# Altium schematic sheet adl5960-main.SchDoc: ADL5960 + Sterowanie
size 420 x 297 mm; SheetNumber: 2; SheetTotal: 2; DocumentType: Schemat elektryczny
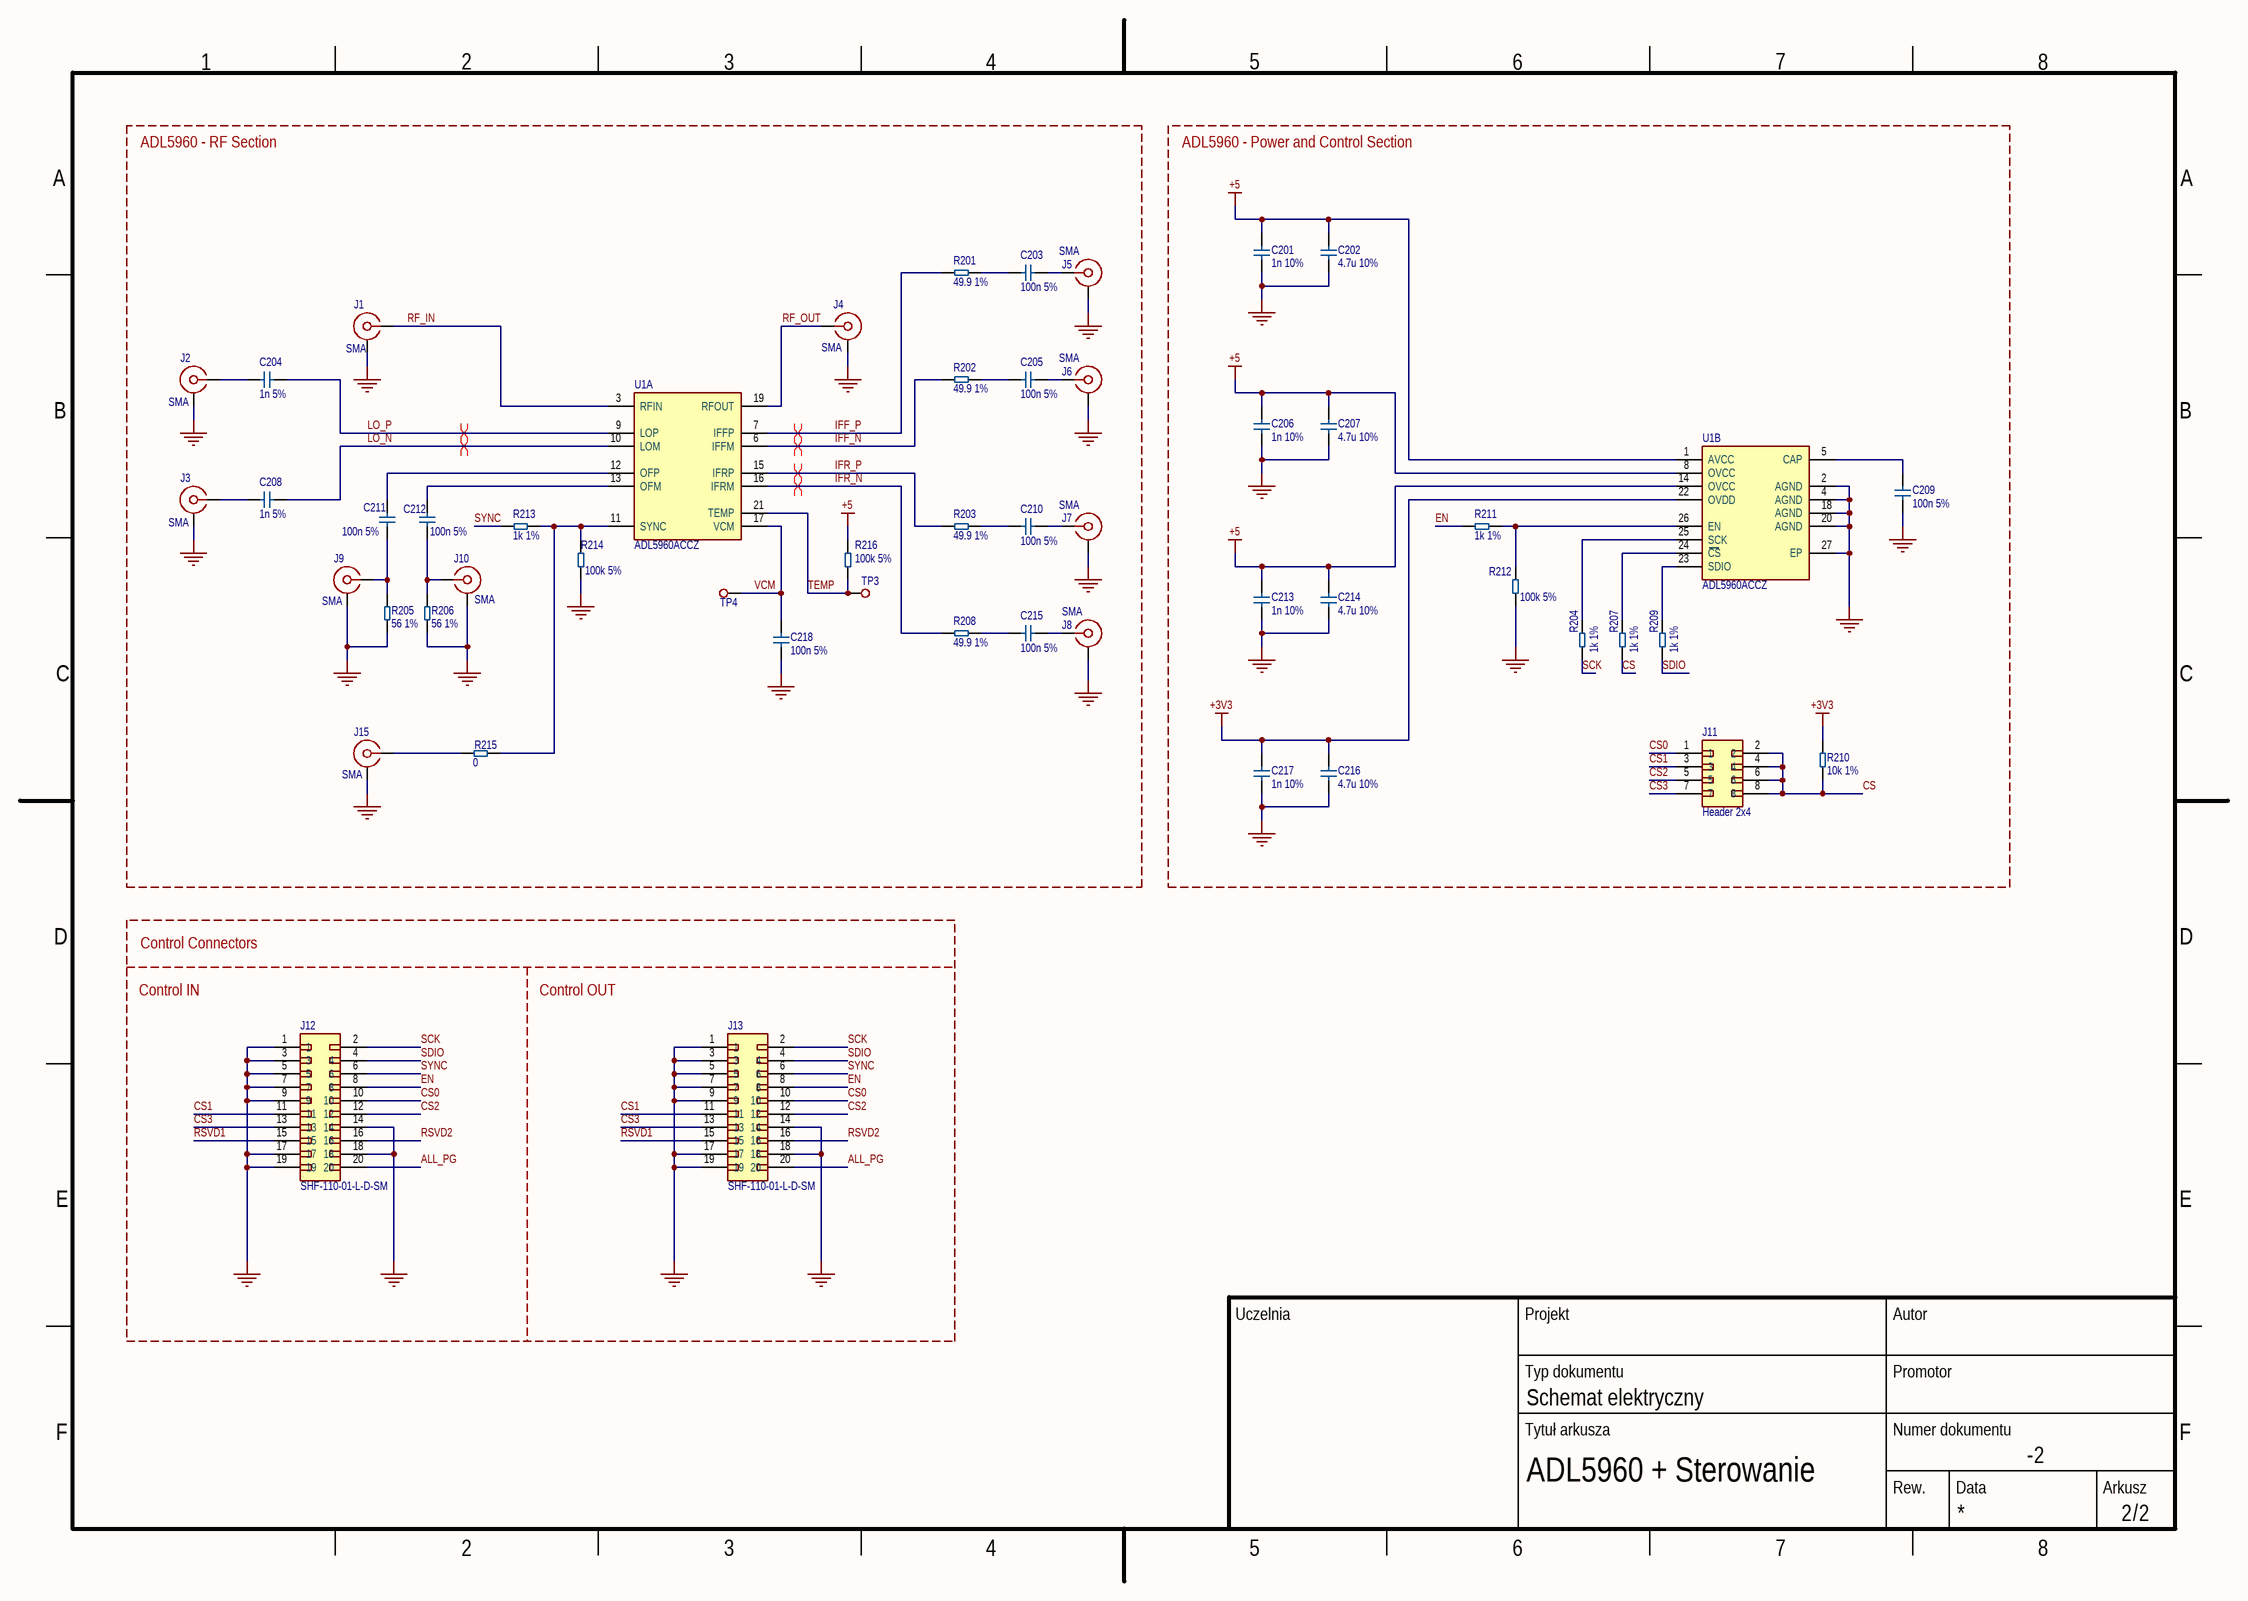
[diagram p0: adl5960-main.SchDoc]

## Parts
C201  1n 10%  [c-0402]
C202  4.7u 10%  [c-0805]
C203  100n 5%  [c-0603]
C204  1n 5%  [c-0402]
C205  100n 5%  [c-0603]
C206  1n 10%  [c-0402]
C207  4.7u 10%  [c-0805]
C208  1n 5%  [c-0402]
C209  100n 5%  [c-0603]
C210  100n 5%  [c-0603]
C211  100n 5%  [c-0603]
C212  100n 5%  [c-0603]
C213  1n 10%  [c-0402]
C214  4.7u 10%  [c-0805]
C215  100n 5%  [c-0603]
C216  4.7u 10%  [c-0805]
C217  1n 10%  [c-0402]
C218  100n 5%  [c-0603]
J1  SMA  [32K243-40ML5]
J2  SMA  [32K243-40ML5]
J3  SMA  [32K243-40ML5]
J4  SMA  [32K243-40ML5]
J5  SMA  [32K243-40ML5]
J6  SMA  [32K243-40ML5]
J7  SMA  [32K243-40ML5]
J8  SMA  [32K243-40ML5]
J9  SMA  [32K243-40ML5]
J10  SMA  [32K243-40ML5]
J11  Header 2x4  [Header-2x4-THT-P2.54]
J12  SHF-110-01-L-D-SM  [SHF-110-01-L-D-SM]
J13  SHF-110-01-L-D-SM  [SHF-110-01-L-D-SM]
J15  SMA  [32K243-40ML5]
R201  49.9 1%  [r-0603]
R202  49.9 1%  [r-0603]
R203  49.9 1%  [r-0603]
R204  1k 1%  [r-0603]
R205  56 1%  [r-0603]
R206  56 1%  [r-0603]
R207  1k 1%  [r-0603]
R208  49.9 1%  [r-0603]
R209  1k 1%  [r-0603]
R210  10k 1%  [r-0603]
R211  1k 1%  [r-0603]
R212  100k 5%  [r-0603]
R213  1k 1%  [r-0603]
R214  100k 5%  [r-0603]
R215  0  [r-0603]
R216  100k 5%  [r-0603]
TP3  Test Point  [tp-keystone-5015]  (value not drawn)
TP4  Test Point  [tp-keystone-5015]  (value not drawn)
U1  ADL5960ACCZ  [ADL5960ACCZ]  (parts A,B of 2)

## Blocks framed on the sheet
ADL5960 - RF Section: C203-C205 C208 C210-C212 C215 C218 J1-J10 J15 R201-R203 R205 R206 R208 R213-R216 TP3 TP4 U1
ADL5960 - Power and Control Section: C201 C202 C206 C207 C209 C213 C214 C216 C217 J11 R204 R207 R209-R212 U1

## Nets
+3V3: C216.2 C217.1 R210.1 U1.22(OVDD)
+5: C201.1 C202.2 C206.1 C207.2 C213.1 C214.2 R216.2 U1.1(AVCC) U1.8(OVCC) U1.14(OVCC)
GND: C201.2 C202.1 C206.2 C207.1 C209.1 C213.2 C214.1 C216.1 C217.2 C218.1 J1.2 J2.2 J3.2 J4.2 J5.2 J6.2 J7.2 J8.2 J9.2 J10.2 J12.1 J12.3 J12.5 J12.7 J12.9 J12.14 J12.17 J12.18 J12.19 J13.1 J13.3 J13.5 J13.7 J13.9 J13.14 J13.17 J13.18 J13.19 J15.2 R205.1 R206.1 R212.1 R214.1 U1.2(AGND) U1.4(AGND) U1.18(AGND) U1.20(AGND) U1.27(EP)
ALL_PG: J12.20 J13.20
CS: J11.2 J11.4 J11.6 J11.8 R207.2 R210.2
CS0: J11.1 J12.10 J13.10
CS1: J11.3 J12.11 J13.11
CS2: J11.5 J12.12 J13.12
CS3: J11.7 J12.13 J13.13
EN: J12.8 J13.8 R211.1
IFF_N: R202.2 U1.6(IFFM)
IFF_P: R201.2 U1.7(IFFP)
IFR_N: R208.2 U1.16(IFRM)
IFR_P: R203.2 U1.15(IFRP)
LO_N: C208.2 U1.10(LOM)
LO_P: C204.2 U1.9(LOP)
RF_IN: J1.1 U1.3(RFIN)
RF_OUT: J4.1 U1.19(RFOUT)
RSVD1: J12.15 J13.15
RSVD2: J12.16 J13.16
SCK: J12.2 J13.2 R204.2
SDIO: J12.4 J13.4 R209.2
SYNC: J12.6 J13.6 R213.1
TEMP: R216.1 TP3.1 U1.21(TEMP)
VCM: C218.2 TP4.1 U1.17(VCM)
NetC203_1: C203.1 R201.1
NetC203_2: C203.2 J5.1
NetC204_1: C204.1 J2.1
NetC205_1: C205.1 R202.1
NetC205_2: C205.2 J6.1
NetC208_1: C208.1 J3.1
NetC209_2: C209.2 U1.5(CAP)
NetC210_1: C210.1 R203.1
NetC210_2: C210.2 J7.1
NetC211_1: C211.1 J9.1 R205.2
NetC211_2: C211.2 U1.12(OFP)
NetC212_1: C212.1 J10.1 R206.2
NetC212_2: C212.2 U1.13(OFM)
NetC215_1: C215.1 R208.1
NetC215_2: C215.2 J8.1
NetJ15_1: J15.1 R215.1
NetR204_1: R204.1 U1.25(SCK)
NetR207_1: R207.1 U1.24(CS)
NetR209_1: R209.1 U1.23(SDIO)
NetR211_2: R211.2 R212.2 U1.26(EN)
NetR213_2: R213.2 R214.2 R215.2 U1.11(SYNC)

## Layout directives
differential pair: IFF_N, IFF_P, IFR_N, IFR_P, LO_N, LO_P

## Notes on the sheet
- 1
- 2
- 3
- 4
- 5
- 6
- 7
- 8
- A
- B
- C
- D
- Control IN
- Control Connectors
- Control OUT
- E
- Uczelnia
- Projekt
- Autor
- Typ dokumentu
- Promotor
- F
- Tytuł arkusza
- Numer dokumentu
- -
- Rew.
- Data
- Arkusz
- /

## Library data of the parts
C201 C206 C213 C217 = capacitor: Generic non-polarized capacitor; Manufacturer: KEMET; Manufacturer Part Number: C0402C102K8GACTU; Voltage Rating: 10V; Dielectric: C0G; Value: 1n; Tolerance: 10%
C202 C207 C214 C216 = Capacitor: Generic non-polarized capacitor; Manufacturer: KEMET; Manufacturer Part Number: C0805C475K4RACTU; Voltage Rating: 16V; Dielectric: X7R; Value: 4.7u; Tolerance: 10%
C203 C205 C209-C212 C215 C218 = Capacitor: Generic non-polarized capacitor; Manufacturer: KEMET; Manufacturer Part Number: C0603C104J4RACTU; Voltage Rating: 16V; Dielectric: X7R; Value: 100n; Tolerance: 5%
C204 C208 = Capacitor: Generic non-polarized capacitor; Manufacturer: KEMET; Manufacturer Part Number: C0402C102J4GACTU; Voltage Rating: 16V; Dielectric: C0G; Value: 1n; Tolerance: 5%
J1-J10 J15 = 32K243-40ML5: Rf Coaxial Connector, 50 Ohm, In-series, Sma Right Angle Jack Pcb, Sma Series; Manufacturer: Rosenberger; Contact Resistance: 3mΩ; Contact Style: Coax; Dielectric Material: PTFE; Frequency: 18GHz; Gender: Female; Impedance: 50Ω; Insertion Loss (dB): 0.17dB; Insulation Resistance: 5GΩ; Number of Contacts: 1; Voltage Rating: 480V; Supplier: Mouser; Supplier Part Number: 476-32K243-40ML5; Manufacturer Part Number: 32K243-40ML5; RoHS: Compliant; Category: RF / Coaxial Connectors; Stock: 5444; Pricing: 1=20.21, 10=17.36, 50=15.71, 100=14.66, 1000=13.36, 10000=13.36 (USD); Ambient Temperature Range High: 165°C; Case/Package: SMA; China RoHS: Non-Compliant; Contact Material: Gold; Contact Plating: Gold; Export Control Classification Number (ECCN) Code: EAR99; Fastening Type: Threaded; Harmonized Tariff Schedule (HTS) Code: 8536.69.40.10; Introduction Date: 2007-04-18; Lifecycle Status: Production; Max Operating Temperature: 165°C; Manufacturer Package Identifier: 32K243-40ML5; Min Operating Temperature: -65°C; Number of Ports: 1; Number of Positions: 1; Orientation: Right Angle; REACH SVHC: Affected; ComponentLink1URL: https://sigma.octopart.com:443/138897775/technical_drawing/Rosenberger-32K243-40ML5.pdf?src-supplier=Upverter; ComponentLink1Description: https://sigma.octopart.com:443/138897775/technical_drawing/Rosenberger-32K243-40ML5.pdf?src-supplier=Upverter; ComponentLink2URL: https://datasheet.octopart.com:443/32K243-40ML5-Rosenberger-datasheet-136490776.pdf?src-supplier=Upverter; ComponentLink2Description: https://datasheet.octopart.com:443/32K243-40ML5-Rosenberger-datasheet-136490776.pdf?src-supplier=Upverter; ComponentLink3URL: https://datasheet.octopart.com:443/32K243-40ML5-Rosenberger-datasheet-181232220.pdf?src-supplier=IHS; ComponentLink3Description: https://datasheet.octopart.com:443/32K243-40ML5-Rosenberger-datasheet-181232220.pdf?src-supplier=IHS; ComponentLink4URL: https://datasheet.octopart.com:443/32K243-40ML5-Rosenberger-datasheet-154574681.pdf?src-supplier=RS+(Formerly+Allied+Electronics); ComponentLink4Description: https://datasheet.octopart.com:443/32K243-40ML5-Rosenberger-datasheet-154574681.pdf?src-supplier=RS+(Formerly+Allied+Electronics); Supplier 1: Mouser; Supplier Part Number 1: 476-32K243-40ML5
J11 = Header-2x4: Dual-row, 8-pin connector; Manufacturer: Samtec; Manufacturer Part Number: TSW-104-07-G-D
J12 J13 = SHF-110-01-L-D-SM: Pin Header, Wire-to-Board, 1.27 mm, 2 Rows, 20 Contacts, Surface Mount, SHF Series; Manufacturer: Samtec; Manufacturer Lifecycle Status: PRODUCTION; Gender: Male; Max Current Rating: 3A; Number of Contacts: 20; Pitch: 1.27mm; Supplier: RS; Supplier Part Number: 9011876; Manufacturer Part Number: SHF-110-01-L-D-SM; RoHS: Compliant; Category: Headers and Wire Housings; Stock: 708; Contact Material: Bronze; Contact Plating: Gold; Depth: 5.59mm; Housing Color: Black; Housing Material: Polymer; Length: 19.05mm; Lifecycle Status: Production; Max Operating Temperature: 125°C; Min Operating Temperature: -55°C; Pins: 20; Number of Rows: 2; Orientation: Straight; Radiation Hardening: No; REACH SVHC: Unaffected; Termination: Solder; ComponentLink1URL: https://sigma.octopart.com:443/97277425/technical_drawing/Samtec-SHF-110-01-L-D-SM.pdf?src-supplier=Samtec; ComponentLink1Description: https://sigma.octopart.com:443/97277425/technical_drawing/Samtec-SHF-110-01-L-D-SM.pdf?src-supplier=Samtec; ComponentLink2URL: https://datasheet.octopart.com:443/SHF-110-01-L-D-SM-Samtec-datasheet-96974960.pdf?src-supplier=Samtec; ComponentLink2Description: https://datasheet.octopart.com:443/SHF-110-01-L-D-SM-Samtec-datasheet-96974960.pdf?src-supplier=Samtec; ComponentLink3URL: https://datasheet.octopart.com:443/SHF-110-01-L-D-SM-Samtec-datasheet-118492834.pdf?src-supplier=Sager+Electronics; ComponentLink3Description: https://datasheet.octopart.com:443/SHF-110-01-L-D-SM-Samtec-datasheet-118492834.pdf?src-supplier=Sager+Electronics; ComponentLink4URL: https://datasheet.octopart.com:443/SHF-110-01-L-D-SM-Samtec-datasheet-154853690.pdf?src-supplier=Sager+Electronics; ComponentLink4Description: https://datasheet.octopart.com:443/SHF-110-01-L-D-SM-Samtec-datasheet-154853690.pdf?src-supplier=Sager+Electronics; ComponentLink5URL: https://datasheet.octopart.com:443/SHF-110-01-L-D-SM-Samtec-datasheet-41643068.pdf?src-supplier=Newark; ComponentLink5Description: https://datasheet.octopart.com:443/SHF-110-01-L-D-SM-Samtec-datasheet-41643068.pdf?src-supplier=Newark; ComponentLink6URL: https://datasheet.octopart.com:443/SHF-110-01-L-D-SM-Samtec-datasheet-14716432.pdf?src-supplier=Newark; ComponentLink6Description: https://datasheet.octopart.com:443/SHF-110-01-L-D-SM-Samtec-datasheet-14716432.pdf?src-supplier=Newark; ComponentLink7URL: https://datasheet.octopart.com:443/SHF-110-01-L-D-SM-Samtec-datasheet-63880525.pdf?src-supplier=Newark; ComponentLink7Description: https://datasheet.octopart.com:443/SHF-110-01-L-D-SM-Samtec-datasheet-63880525.pdf?src-supplier=Newark; ComponentLink8URL: https://datasheet.octopart.com:443/SHF-110-01-L-D-SM-Samtec-datasheet-21214285.pdf?src-supplier=Newark; ComponentLink8Description: https://datasheet.octopart.com:443/SHF-110-01-L-D-SM-Samtec-datasheet-21214285.pdf?src-supplier=Newark; ComponentLink9URL: https://datasheet.octopart.com:443/SHF-110-01-L-D-SM-Samtec-datasheet-118892784.pdf?src-supplier=Master+Electronics; ComponentLink9Description: https://datasheet.octopart.com:443/SHF-110-01-L-D-SM-Samtec-datasheet-118892784.pdf?src-supplier=Master+Electronics; ComponentLink10URL: https://datasheet.octopart.com:443/SHF-110-01-L-D-SM-Samtec-datasheet-116534221.pdf?src-supplier=Toby+Electronics; ComponentLink10Description: https://datasheet.octopart.com:443/SHF-110-01-L-D-SM-Samtec-datasheet-116534221.pdf?src-supplier=Toby+Electronics; ComponentLink11URL: https://datasheet.octopart.com:443/SHF-110-01-L-D-SM-Samtec-datasheet-116536228.pdf?src-supplier=Toby+Electronics; ComponentLink11Description: https://datasheet.octopart.com:443/SHF-110-01-L-D-SM-Samtec-datasheet-116536228.pdf?src-supplier=Toby+Electronics; ComponentLink12URL: https://datasheet.octopart.com:443/SHF-110-01-L-D-SM-Samtec-datasheet-14716430.pdf?src-supplier=Farnell; ComponentLink12Description: https://datasheet.octopart.com:443/SHF-110-01-L-D-SM-Samtec-datasheet-14716430.pdf?src-supplier=Farnell
R201-R203 R208 = Resistor: Generic resistor; Manufacturer: YAGEO; Manufacturer Part Number: AC0603FR-0749R9L; Value: 49.9; Power Rating: 100mW; Tolerance: 1%
R204 R207 R209 R211 R213 = Resistor: Generic resistor; Manufacturer: YAGEO; Manufacturer Part Number: AC0603FR-071KL; Power Rating: 100mW; Value: 1k; Tolerance: 1%
R205 R206 = Resistor: Generic resistor; Manufacturer: YAGEO; Manufacturer Part Number: AC0603FR-0756RL; Value: 56; Power Rating: 100mW; Tolerance: 1%
R210 = Resistor: Generic resistor; Manufacturer: YAGEO; Manufacturer Part Number: AC0603FRE0710KL; Power Rating: 100mW; Value: 10k; Tolerance: 1%
R212 R214 R216 = Resistor: Generic resistor; Manufacturer: YAGEO; Manufacturer Part Number: AC0603JR-07100KL; Power Rating: 100mW; Value: 100k; Tolerance: 5%
R215 = Resistor: Manufacturer: YAGEO; Manufacturer Part Number: AC0603FR-070RL; Power Rating: 100mW; Value: 0
TP3 TP4 = TestPoint
U1 = ADL5960ACCZ: 10 MHz to 20 GHz Integrated Vector Network Analyzer Front End; Manufacturer: Analog Devices; Manufacturer Lifecycle Status: PRODUCTION; Supplier: Farnell; Supplier Part Number: ADL5960ACCZ; Manufacturer Part Number: ADL5960ACCZ; Category: Uncategorized; Stock: 30; Lifecycle Status: Production; ComponentLink1URL: https://octopart.com:443/opatz8j6/c1?t=sNn__E9if7phYpKIGt1HGors_3fkiZxAOk72fyHCpcdGdEVv4rI4oJjph59vRY8RkB2W6v6FUDb5vdq2LBbZOBejgV7lxPf1byVkt5o1bTHGBtKKZ6Tb3MUQ4F5jve5jIWWR5DzlCFF3u66MTO-qwqQC24WdVR_dh-itx28DAXgluqoEWVUgxFMfBbjVdfTk_KnL56IoFFq5EsB3mzvz68whwf5lUIDgQKXuAkuEH9EekJ4yxnZRnlukBpMqeuNE75q6lyql7jt9fMK9L5vifS7jSQ0phH-iyEfXCpMlEKgYs4T2ZLlJAKc&src-supplier=Analog+Devices; ComponentLink1Description: https://octopart.com:443/opatz8j6/c1?t=sNn__E9if7phYpKIGt1HGors_3fkiZxAOk72fyHCpcdGdEVv4rI4oJjph59vRY8RkB2W6v6FUDb5vdq2LBbZOBejgV7lxPf1byVkt5o1bTHGBtKKZ6Tb3MUQ4F5jve5jIWWR5DzlCFF3u66MTO-qwqQC24WdVR_dh-itx28DAXgluqoEWVUgxFMfBbjVdfTk_KnL56IoFFq5EsB3mzvz68whwf5lUIDgQKXuAkuEH9EekJ4yxnZRnlukBpMqeuNE75q6lyql7jt9fMK9L5vifS7jSQ0phH-iyEfXCpMlEKgYs4T2ZLlJAKc&src-supplier=Analog+Devices; ComponentLink2URL: http://sigma.octopart.com:80/conflict_mineral_statement/Analog-Devices-company-33.pdf?src-supplier=Compliance+Statements; ComponentLink2Description: http://sigma.octopart.com:80/conflict_mineral_statement/Analog-Devices-company-33.pdf?src-supplier=Compliance+Statements; ComponentLink3URL: https://octopart.com:443/opatz8j6/c1?t=wHYJiqXauK4GQM2tQ_zDqUa69f3N-5zA8TKZKGG1nxLidXH63u1cM0l-QN9E_93qqH5iv-1ZwJaGS180fzg_5Oe7Zc70L6wz2jI3y8w5lOGbgZyt_6NHhOm9jFHXaC4goDV5tsi3ZeeHrBwAQ6jdg7bzlT8NTI2okqPMewkI4fW6NGQpSGyHBCKZ0RyHdS3IP7gHGcc2ag_P3vSw00v3vkIXauamRiOkOWDHR5I_2w_ejY6bXPncjy1qH_sL9J1lP9Udtz3B5do7UwqucEogziSC9qVfJGWqMtIPTtJ4546mLJoeyxvlv0E&src-supplier=Compliance+Statements; ComponentLink3Description: https://octopart.com:443/opatz8j6/c1?t=wHYJiqXauK4GQM2tQ_zDqUa69f3N-5zA8TKZKGG1nxLidXH63u1cM0l-QN9E_93qqH5iv-1ZwJaGS180fzg_5Oe7Zc70L6wz2jI3y8w5lOGbgZyt_6NHhOm9jFHXaC4goDV5tsi3ZeeHrBwAQ6jdg7bzlT8NTI2okqPMewkI4fW6NGQpSGyHBCKZ0RyHdS3IP7gHGcc2ag_P3vSw00v3vkIXauamRiOkOWDHR5I_2w_ejY6bXPncjy1qH_sL9J1lP9Udtz3B5do7UwqucEogziSC9qVfJGWqMtIPTtJ4546mLJoeyxvlv0E&src-supplier=Compliance+Statements; Supplier 1: Farnell; Supplier Part Number 1: ADL5960ACCZ